# Altium schematic sheet 15_Debug.SchDoc
size 812 x 508 mm; SheetNumber: 15; SheetTotal: 16
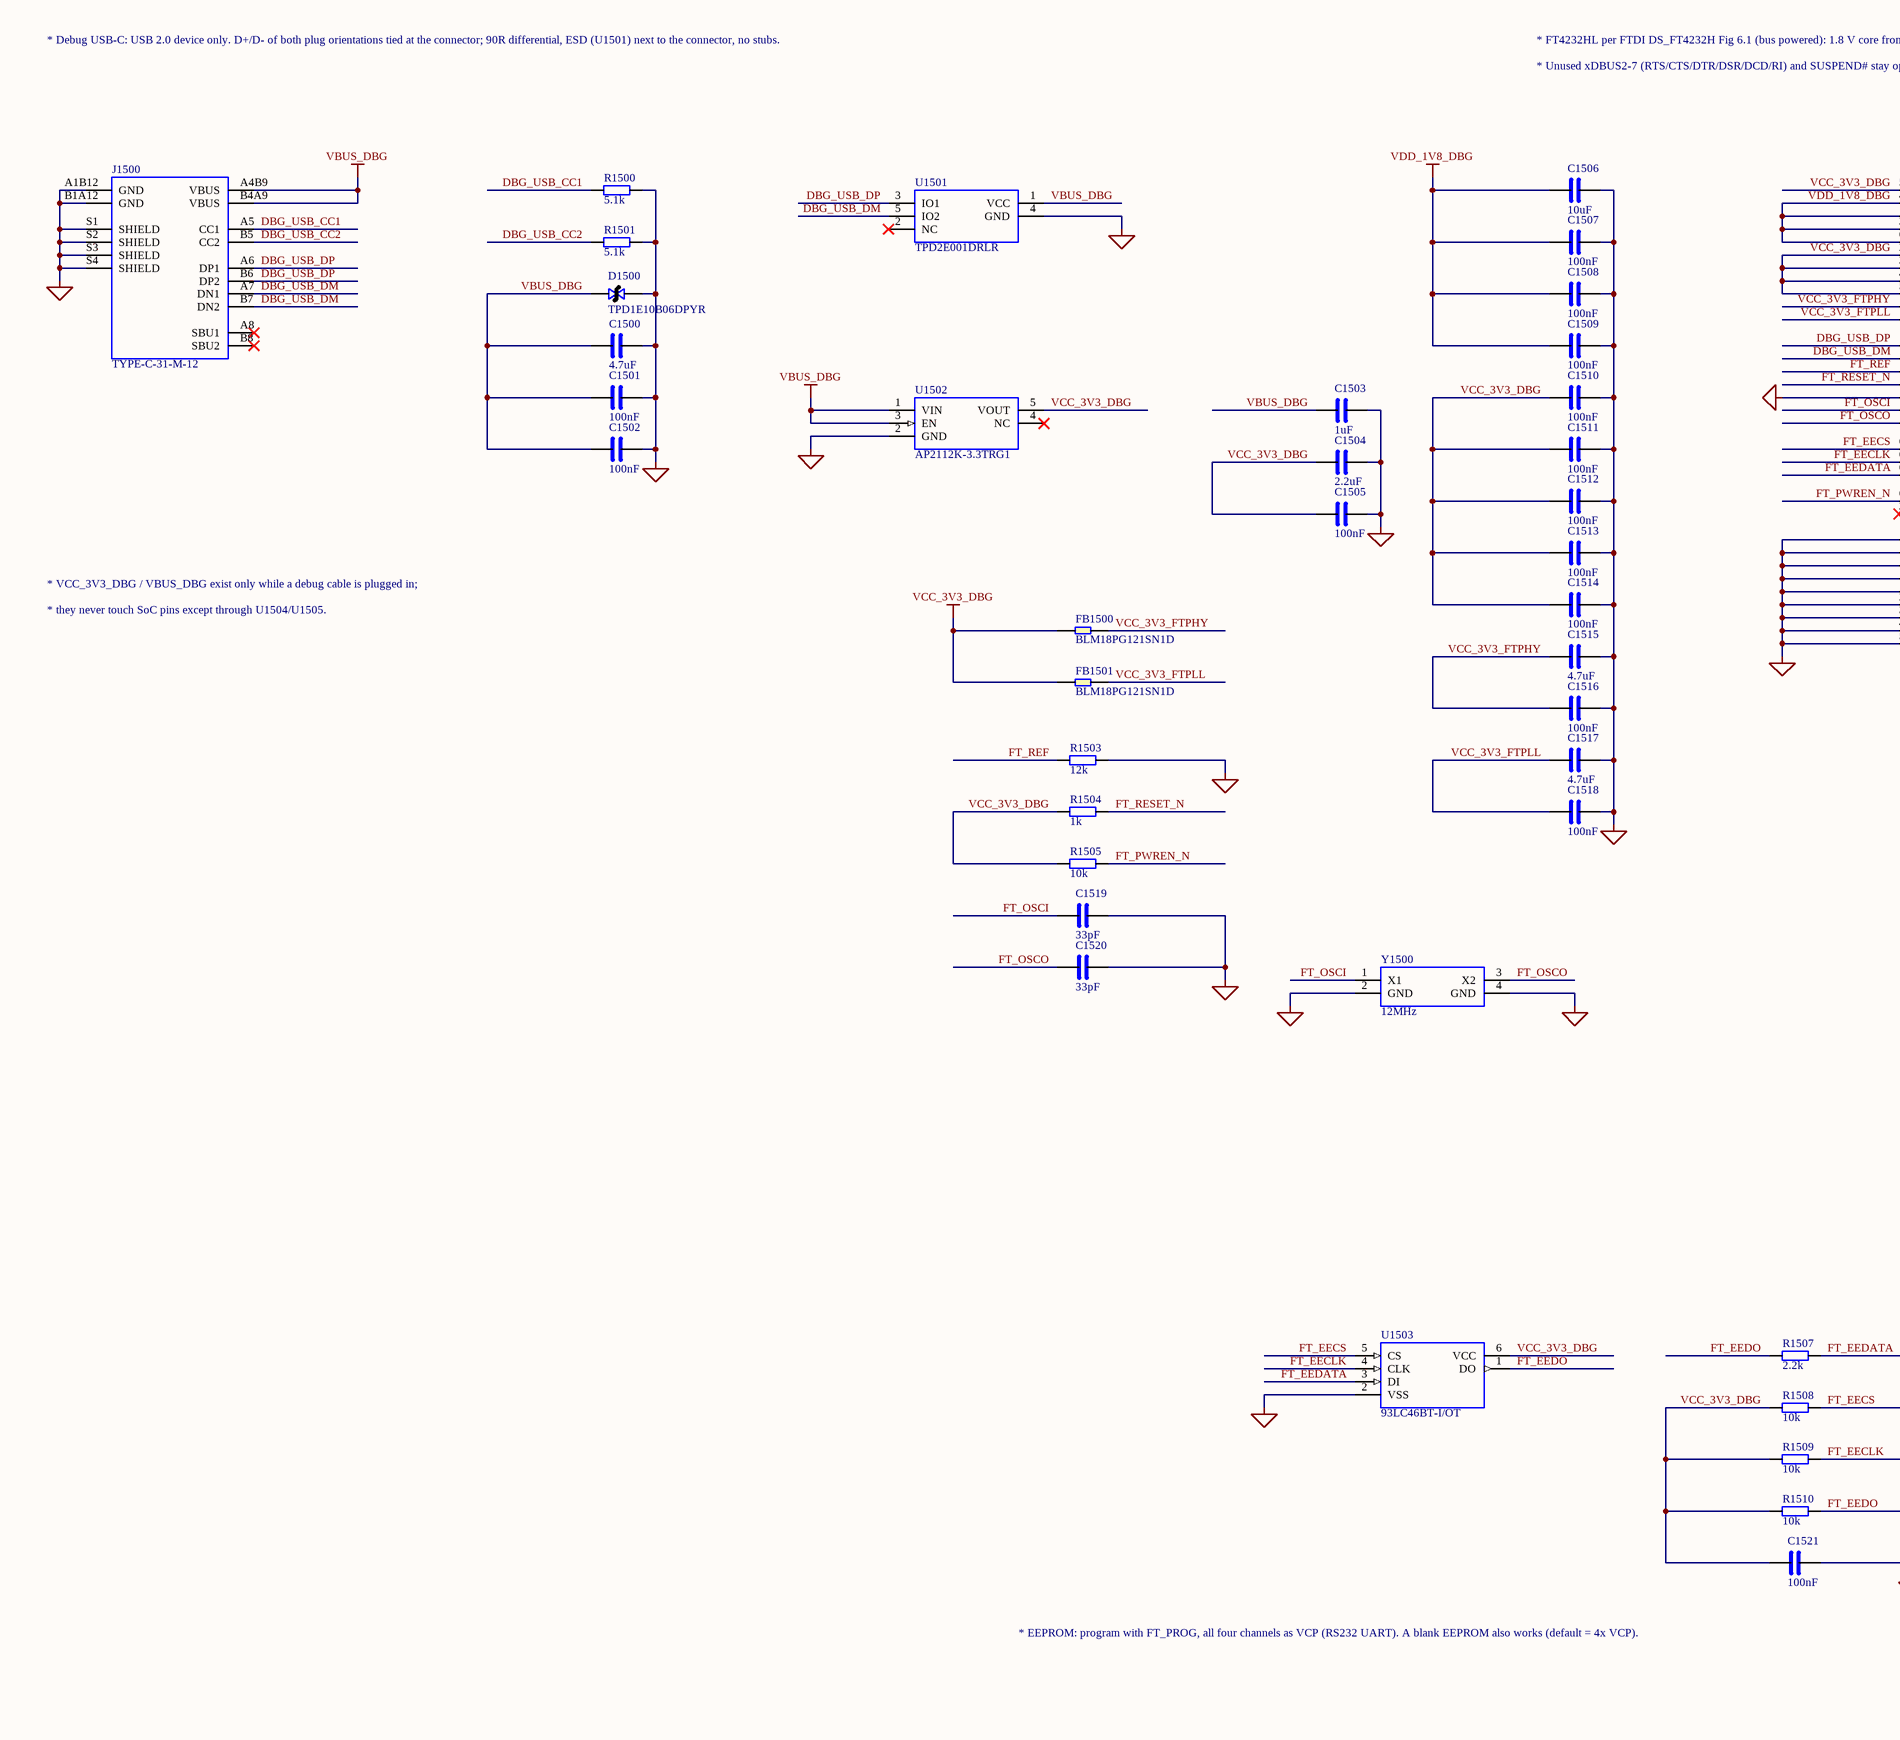
[diagram p0: 15_Debug.SchDoc, left]
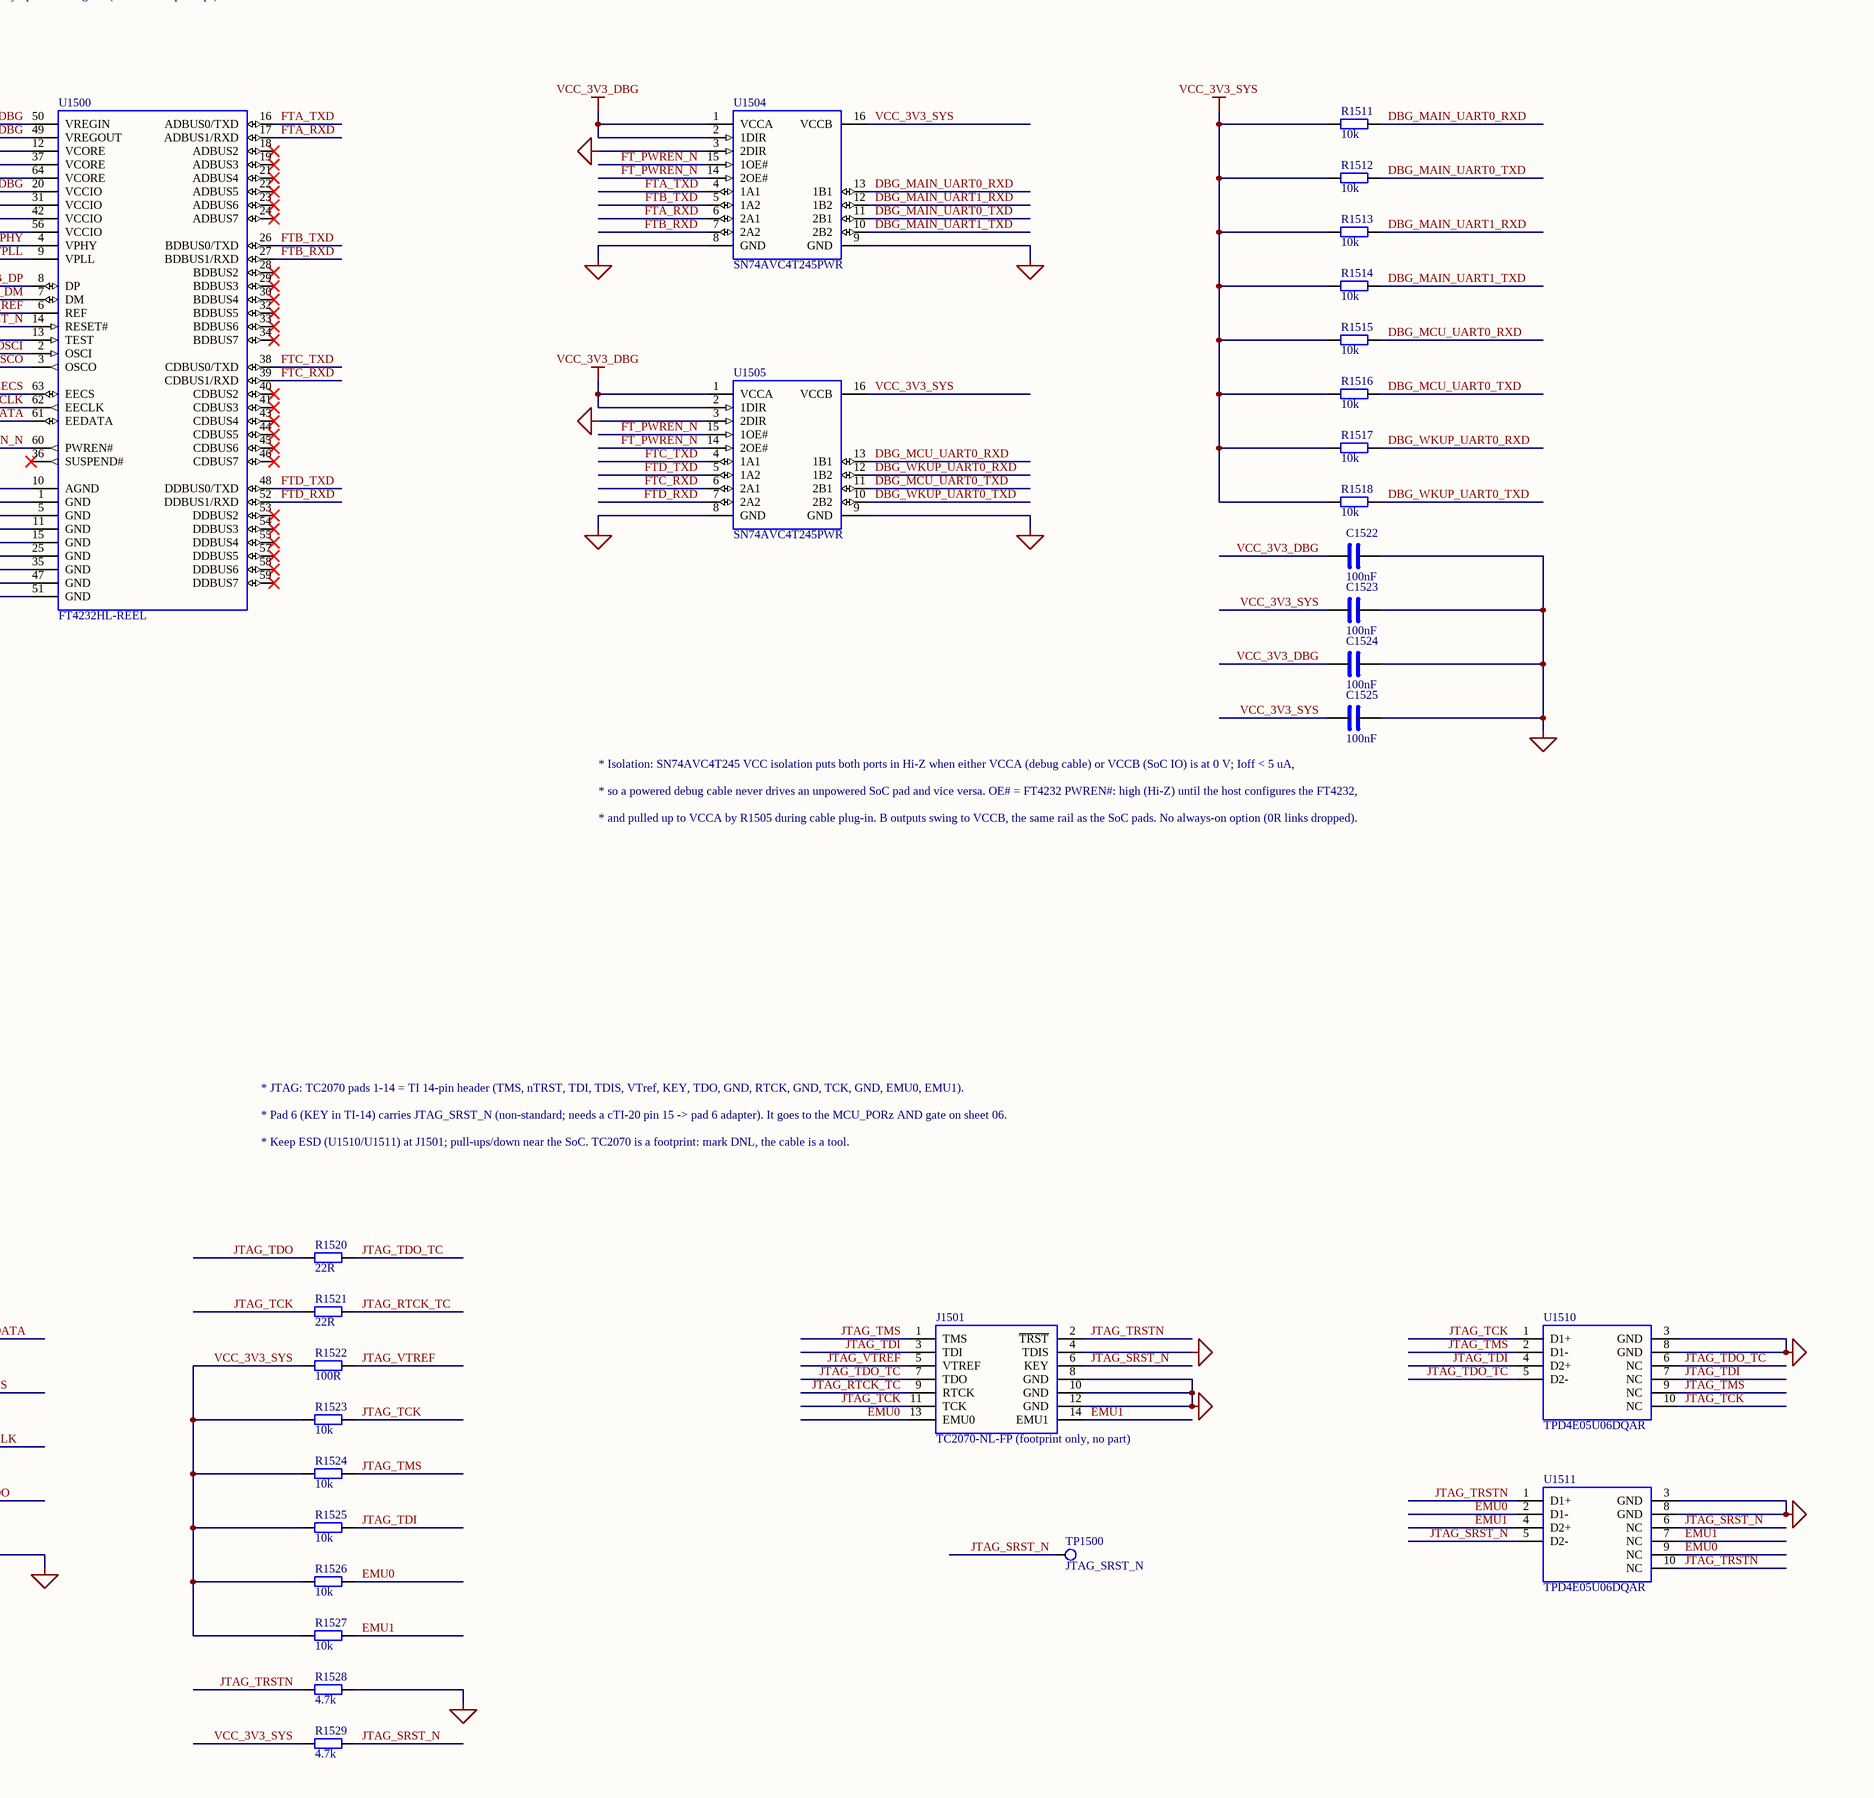
[diagram p1: 15_Debug.SchDoc, right]

## Parts
C1500  4.7uF  [C0603]
C1501  100nF  [C0402]
C1502  100nF  [C0402]
C1503  1uF  [C0402]
C1504  2.2uF  [C0402]
C1505  100nF  [C0402]
C1506  10uF  [C0603]
C1507  100nF  [C0402]
C1508  100nF  [C0402]
C1509  100nF  [C0402]
C1510  100nF  [C0402]
C1511  100nF  [C0402]
C1512  100nF  [C0402]
C1513  100nF  [C0402]
C1514  100nF  [C0402]
C1515  4.7uF  [C0402]
C1516  100nF  [C0402]
C1517  4.7uF  [C0402]
C1518  100nF  [C0402]
C1519  33pF  [C0402]
C1520  33pF  [C0402]
C1521  100nF  [C0402]
C1522  100nF  [C0402]
C1523  100nF  [C0402]
C1524  100nF  [C0402]
C1525  100nF  [C0402]
D1500  TPD1E10B06DPYR  [X1SON2_DPY]
FB1500  BLM18PG121SN1D  [FB0603]
FB1501  BLM18PG121SN1D  [FB0603]
J1500  TYPE-C-31-M-12  [USB-C_HRO_TYPE-C-31-M-12]
J1501  TC2070-NL-FP (footprint only, no part)  [TC2070-NL]
R1500  5.1k  [R0402]
R1501  5.1k  [R0402]
R1503  12k  [R0402]
R1504  1k  [R0402]
R1505  10k  [R0402]
R1507  2.2k  [R0402]
R1508  10k  [R0402]
R1509  10k  [R0402]
R1510  10k  [R0402]
R1511  10k  [R0402]
R1512  10k  [R0402]
R1513  10k  [R0402]
R1514  10k  [R0402]
R1515  10k  [R0402]
R1516  10k  [R0402]
R1517  10k  [R0402]
R1518  10k  [R0402]
R1520  22R  [R0402]
R1521  22R  [R0402]
R1522  100R  [R0402]
R1523  10k  [R0402]
R1524  10k  [R0402]
R1525  10k  [R0402]
R1526  10k  [R0402]
R1527  10k  [R0402]
R1528  4.7k  [R0402]
R1529  4.7k  [R0402]
TP1500  JTAG_SRST_N  [TP_PAD_1.0]
U1500  FT4232HL-REEL  [LQFP64_10X10_P0.5]
U1501  TPD2E001DRLR  [SOT553-5]
U1502  AP2112K-3.3TRG1  [SOT23-5]
U1503  93LC46BT-I/OT  [SOT23-6]
U1504  SN74AVC4T245PWR  [TSSOP16_4.4X5.0_P0.65]
U1505  SN74AVC4T245PWR  [TSSOP16_4.4X5.0_P0.65]
U1510  TPD4E05U06DQAR  [USON10_DQA]
U1511  TPD4E05U06DQAR  [USON10_DQA]
Y1500  12MHz  [XTAL_3225_4P]

## Nets
GND: C1500.2 C1501.2 C1502.2 C1503.2 C1504.2 C1505.2 C1506.2 C1507.2 C1508.2 C1509.2 C1510.2 C1511.2 C1512.2 C1513.2 C1514.2 C1515.2 C1516.2 C1517.2 C1518.2 C1519.2 C1520.2 C1521.2 C1522.2 C1523.2 C1524.2 C1525.2 D1500.2 J1500.A1B12(GND) J1500.B1A12(GND) J1500.S1(SHIELD) J1500.S2(SHIELD) J1500.S3(SHIELD) J1500.S4(SHIELD) J1501.4(TDIS) J1501.8(GND) J1501.10(GND) J1501.12(GND) R1500.2 R1501.2 R1503.2 R1528.2 U1500.1(GND) U1500.5(GND) U1500.10(AGND) U1500.11(GND) U1500.13(TEST) U1500.15(GND) U1500.25(GND) U1500.35(GND) U1500.47(GND) U1500.51(GND) U1501.4(GND) U1502.2(GND) U1503.2(VSS) U1504.3(2DIR) U1504.8(GND) U1504.9(GND) U1505.3(2DIR) U1505.8(GND) U1505.9(GND) U1510.3(GND) U1510.8(GND) U1511.3(GND) U1511.8(GND) Y1500.2(GND) Y1500.4(GND)
VBUS_DBG: C1500.1 C1501.1 C1502.1 C1503.1 D1500.1 J1500.A4B9(VBUS) J1500.B4A9(VBUS) U1501.1(VCC) U1502.1(VIN) U1502.3(EN)
VCC_3V3_DBG: C1504.1 C1505.1 C1510.1 C1511.1 C1512.1 C1513.1 C1514.1 C1521.1 C1522.1 C1524.1 FB1500.1 FB1501.1 R1504.1 R1505.1 R1508.1 R1509.1 R1510.1 U1500.20(VCCIO) U1500.31(VCCIO) U1500.42(VCCIO) U1500.50(VREGIN) U1500.56(VCCIO) U1502.5(VOUT) U1503.6(VCC) U1504.1(VCCA) U1504.2(1DIR) U1505.1(VCCA) U1505.2(1DIR)
VCC_3V3_SYS: C1523.1 C1525.1 R1511.1 R1512.1 R1513.1 R1514.1 R1515.1 R1516.1 R1517.1 R1518.1 R1522.1 R1523.1 R1524.1 R1525.1 R1526.1 R1527.1 R1529.1 U1504.16(VCCB) U1505.16(VCCB)
VDD_1V8_DBG: C1506.1 C1507.1 C1508.1 C1509.1 U1500.12(VCORE) U1500.37(VCORE) U1500.49(VREGOUT) U1500.64(VCORE)
DBG_MAIN_UART0_RXD: R1511.2 U1504.13(1B1)
DBG_MAIN_UART0_TXD: R1512.2 U1504.11(2B1)
DBG_MAIN_UART1_RXD: R1513.2 U1504.12(1B2)
DBG_MAIN_UART1_TXD: R1514.2 U1504.10(2B2)
DBG_MCU_UART0_RXD: R1515.2 U1505.13(1B1)
DBG_MCU_UART0_TXD: R1516.2 U1505.11(2B1)
DBG_USB_CC1: J1500.A5(CC1) R1500.1
DBG_USB_CC2: J1500.B5(CC2) R1501.1
DBG_USB_DM: J1500.A7(DN1) J1500.B7(DN2) U1500.7(DM) U1501.5(IO2)
DBG_USB_DP: J1500.A6(DP1) J1500.B6(DP2) U1500.8(DP) U1501.3(IO1)
DBG_WKUP_UART0_RXD: R1517.2 U1505.12(1B2)
DBG_WKUP_UART0_TXD: R1518.2 U1505.10(2B2)
EMU0: J1501.13(EMU0) R1526.2 U1511.2(D1-) U1511.9(NC)
EMU1: J1501.14(EMU1) R1527.2 U1511.4(D2+) U1511.7(NC)
FT_EECLK: R1509.2 U1500.62(EECLK) U1503.4(CLK)
FT_EECS: R1508.2 U1500.63(EECS) U1503.5(CS)
FT_EEDATA: R1507.2 U1500.61(EEDATA) U1503.3(DI)
FT_EEDO: R1507.1 R1510.2 U1503.1(DO)
FT_OSCI: C1519.1 U1500.2(OSCI) Y1500.1(X1)
FT_OSCO: C1520.1 U1500.3(OSCO) Y1500.3(X2)
FT_PWREN_N: R1505.2 U1500.60(PWREN#) U1504.14(2OE#) U1504.15(1OE#) U1505.14(2OE#) U1505.15(1OE#)
FT_REF: R1503.1 U1500.6(REF)
FT_RESET_N: R1504.2 U1500.14(RESET#)
FTA_RXD: U1500.17(ADBUS1/RXD) U1504.6(2A1)
FTA_TXD: U1500.16(ADBUS0/TXD) U1504.4(1A1)
FTB_RXD: U1500.27(BDBUS1/RXD) U1504.7(2A2)
FTB_TXD: U1500.26(BDBUS0/TXD) U1504.5(1A2)
FTC_RXD: U1500.39(CDBUS1/RXD) U1505.6(2A1)
FTC_TXD: U1500.38(CDBUS0/TXD) U1505.4(1A1)
FTD_RXD: U1500.52(DDBUS1/RXD) U1505.7(2A2)
FTD_TXD: U1500.48(DDBUS0/TXD) U1505.5(1A2)
JTAG_RTCK_TC: J1501.9(RTCK) R1521.2
JTAG_SRST_N: J1501.6(KEY) R1529.2 TP1500.1(TP) U1511.5(D2-) U1511.6(NC)
JTAG_TCK: J1501.11(TCK) R1521.1 R1523.2 U1510.1(D1+) U1510.10(NC)
JTAG_TDI: J1501.3(TDI) R1525.2 U1510.4(D2+) U1510.7(NC)
JTAG_TDO: R1520.1
JTAG_TDO_TC: J1501.7(TDO) R1520.2 U1510.5(D2-) U1510.6(NC)
JTAG_TMS: J1501.1(TMS) R1524.2 U1510.2(D1-) U1510.9(NC)
JTAG_TRSTN: J1501.2(~{TRST}) R1528.1 U1511.1(D1+) U1511.10(NC)
JTAG_VTREF: J1501.5(VTREF) R1522.2
VCC_3V3_FTPHY: C1515.1 C1516.1 FB1500.2 U1500.4(VPHY)
VCC_3V3_FTPLL: C1517.1 C1518.1 FB1501.2 U1500.9(VPLL)

Not connected (* = marked no-connect by the designer): J1500 A8(SBU1)* B8(SBU2)*; U1500 18(ADBUS2)* 19(ADBUS3)* 21(ADBUS4)* 22(ADBUS5)* 23(ADBUS6)* 24(ADBUS7)* 28(BDBUS2)* 29(BDBUS3)* 30(BDBUS4)* 32(BDBUS5)* 33(BDBUS6)* 34(BDBUS7)* 36(SUSPEND#)* 40(CDBUS2)* 41(CDBUS3)* 43(CDBUS4)* 44(CDBUS5)* 45(CDBUS6)* 46(CDBUS7)* 53(DDBUS2)* 54(DDBUS3)* 55(DDBUS4)* 57(DDBUS5)* 58(DDBUS6)* 59(DDBUS7)*; U1501 2(NC)*; U1502 4(NC)*

## Notes on the sheet
- * Debug USB-C: USB 2.0 device only. D+/D- of both plug orientations tied at the connector; 90R differential, ESD (U1501) next to the connector, no stubs.
- * FT4232HL per FTDI DS_FT4232H Fig 6.1 (bus powered): 1.8 V core from its own VREGOUT, VPHY/VPLL through 120R beads.
- * Unused xDBUS2-7 (RTS/CTS/DTR/DSR/DCD/RI) and SUSPEND# stay open as in Fig 6.1 (internal 75k pull-ups). TEST to GND.
- * VCC_3V3_DBG / VBUS_DBG exist only while a debug cable is plugged in;
- * they never touch SoC pins except through U1504/U1505.
- (near C1525) * Isolation: SN74AVC4T245 VCC isolation puts both ports in Hi-Z when either VCCA (debug cable) or VCCB (SoC IO) is at 0 V; Ioff < 5 uA,
- * so a powered debug cable never drives an unpowered SoC pad and vice versa. OE# = FT4232 PWREN#: high (Hi-Z) until the host configures the FT4232,
- * and pulled up to VCCA by R1505 during cable plug-in. B outputs swing to VCCB, the same rail as the SoC pads. No always-on option (0R links dropped).
- * JTAG: TC2070 pads 1-14 = TI 14-pin header (TMS, nTRST, TDI, TDIS, VTref, KEY, TDO, GND, RTCK, GND, TCK, GND, EMU0, EMU1).
- * Pad 6 (KEY in TI-14) carries JTAG_SRST_N (non-standard; needs a cTI-20 pin 15 -> pad 6 adapter). It goes to the MCU_PORz AND gate on sheet 06.
- * Keep ESD (U1510/U1511) at J1501; pull-ups/down near the SoC. TC2070 is a footprint: mark DNL, the cable is a tool.
- * EEPROM: program with FT_PROG, all four channels as VCP (RS232 UART). A blank EEPROM also works (default = 4x VCP).

## Library data of the parts
C1500 = CAP: Capacitor, non-polarized; Spec: 4.7uF 10V X5R 0603 (VBUS; total <= 10uF)
C1501 = CAP: Capacitor, non-polarized; Spec: 100nF 16V X7R 0402
C1502 = CAP: Capacitor, non-polarized; Spec: 100nF 16V X7R 0402 (TPD2E001 VCC)
C1503 = CAP: Capacitor, non-polarized; Spec: 1uF 10V X5R 0402 (LDO in)
C1504 = CAP: Capacitor, non-polarized; Spec: 2.2uF 10V X5R 0402 (LDO out)
C1505 = CAP: Capacitor, non-polarized; Spec: 100nF 16V X7R 0402 (LDO out)
C1506 = CAP: Capacitor, non-polarized; Spec: 10uF 10V X5R 0603 (VREGOUT, >= 3.3uF effective)
C1507 = CAP: Capacitor, non-polarized; Spec: 100nF 16V X7R 0402 (VCORE 12)
C1508 = CAP: Capacitor, non-polarized; Spec: 100nF 16V X7R 0402 (VCORE 37)
C1509 = CAP: Capacitor, non-polarized; Spec: 100nF 16V X7R 0402 (VCORE 64)
C1510 = CAP: Capacitor, non-polarized; Spec: 100nF 16V X7R 0402 (VREGIN)
C1511 = CAP: Capacitor, non-polarized; Spec: 100nF 16V X7R 0402 (VCCIO 20)
C1512 = CAP: Capacitor, non-polarized; Spec: 100nF 16V X7R 0402 (VCCIO 31)
C1513 = CAP: Capacitor, non-polarized; Spec: 100nF 16V X7R 0402 (VCCIO 42)
C1514 = CAP: Capacitor, non-polarized; Spec: 100nF 16V X7R 0402 (VCCIO 56)
C1515 = CAP: Capacitor, non-polarized; Spec: 4.7uF 10V X5R 0402 (VPHY)
C1516 = CAP: Capacitor, non-polarized; Spec: 100nF 16V X7R 0402 (VPHY)
C1517 = CAP: Capacitor, non-polarized; Spec: 4.7uF 10V X5R 0402 (VPLL)
C1518 = CAP: Capacitor, non-polarized; Spec: 100nF 16V X7R 0402 (VPLL)
C1519 C1520 = CAP: Capacitor, non-polarized; Spec: 33pF 50V C0G 0402 (CL 20pF crystal)
C1521 = CAP: Capacitor, non-polarized; Spec: 100nF 16V X7R 0402 (EEPROM)
C1522 = CAP: Capacitor, non-polarized; Spec: 100nF 16V X7R 0402 (U1504 VCCA)
C1523 = CAP: Capacitor, non-polarized; Spec: 100nF 16V X7R 0402 (U1504 VCCB)
C1524 = CAP: Capacitor, non-polarized; Spec: 100nF 16V X7R 0402 (U1505 VCCA)
C1525 = CAP: Capacitor, non-polarized; Spec: 100nF 16V X7R 0402 (U1505 VCCB)
D1500 = TVS_BI: Bidirectional TVS / ESD diode; Manufacturer: Texas Instruments; MPN: TPD1E10B06DPYR
FB1500 = FERRITE: Ferrite bead; Manufacturer: Murata; Spec: BLM18PG121SN1D 120R@100MHz (VPHY); MPN: BLM18PG121SN1D
FB1501 = FERRITE: Ferrite bead; Manufacturer: Murata; Spec: BLM18PG121SN1D 120R@100MHz (VPLL); MPN: BLM18PG121SN1D
J1500 = TYPE-C-31-M-12: USB Type-C receptacle, USB 2.0 16-contact, SMD R/A, 4 THT shell pegs; Manufacturer: Korean Hroparts (HRO); MPN: TYPE-C-31-M-12
J1501 = TC2070_TI14: Tag-Connect TC2070-NL footprint, TI 14-pin JTAG pinout (pad 6 = KEY); DNP: 1; MPN: TC2070-NL-FP; Manufacturer: Tag-Connect
R1500 R1501 = RES: Resistor; Spec: 5.1k 1% 0402 (Rd, UFP)
R1503 = RES: Resistor; Spec: 12k 1% 0402 (REF)
R1504 = RES: Resistor; Spec: 1k 1% 0402 (RESET# pull-up)
R1505 = RES: Resistor; Spec: 10k 1% 0402 (OE# pull-up)
R1507 = RES: Resistor; Spec: 2.2k 1% 0402
R1508-R1510 R1523-R1527 = RES: Resistor; Spec: 10k 1% 0402
R1511 R1513 R1515 R1517 = RES: Resistor; Spec: 10k 1% 0402 (SoC RXD pull-up)
R1512 R1514 R1516 R1518 = RES: Resistor; Spec: 10k 1% 0402 (SoC TXD pull-up)
R1520 = RES: Resistor; Spec: 22R 1% 0402 (TDO, near SoC)
R1521 = RES: Resistor; Spec: 22R 1% 0402 (RTCK loopback)
R1522 = RES: Resistor; Spec: 100R 1% 0402 (VTref current limit)
R1528 = RES: Resistor; Spec: 4.7k 1% 0402 (TRSTn pull-down)
R1529 = RES: Resistor; DNP: 1; Spec: 4.7k 0402 DNP (sheet 06 R604 already pulls SRST up)
TP1500 = TESTPOINT: Test point
U1500 = FT4232HL: FT4232H quad Hi-Speed USB to UART/MPSSE, LQFP-64; Manufacturer: FTDI; MPN: FT4232HL-REEL
U1501 = TPD2E001_DRL: 2-channel USB ESD array with VCC clamp rail, SOT-5 (DRL); Manufacturer: Texas Instruments; MPN: TPD2E001DRLR
U1502 = AP2112K_SOT25: AP2112K 600 mA CMOS LDO, fixed output, SOT-23-5; Manufacturer: Diodes Incorporated; MPN: AP2112K-3.3TRG1
U1503 = 93LC46B_OT: 93LC46B 1 Kbit Microwire EEPROM (64 x 16), SOT-23-6; Manufacturer: Microchip; MPN: 93LC46BT-I/OT
U1504 U1505 = SN74AVC4T245_PW: Dual 2-bit dual-supply bus transceiver, Ioff + VCC isolation, TSSOP-16; Manufacturer: Texas Instruments; MPN: SN74AVC4T245PWR
U1510 U1511 = TPD4E05U06_DQA: 4-channel 0.5 pF ESD array, USON-10; Manufacturer: Texas Instruments; MPN: TPD4E05U06DQAR
Y1500 = X322512MSB4SI: Crystal 3225 4-pad (1/3 crystal, 2/4 case GND); MPN: FL1200074; Manufacturer: Diodes Incorporated; Spec: 12MHz FL1200074; Supplier: Digi-Key FL1200074